# Altium project Adapter_Board-v1.0.PrjPcb
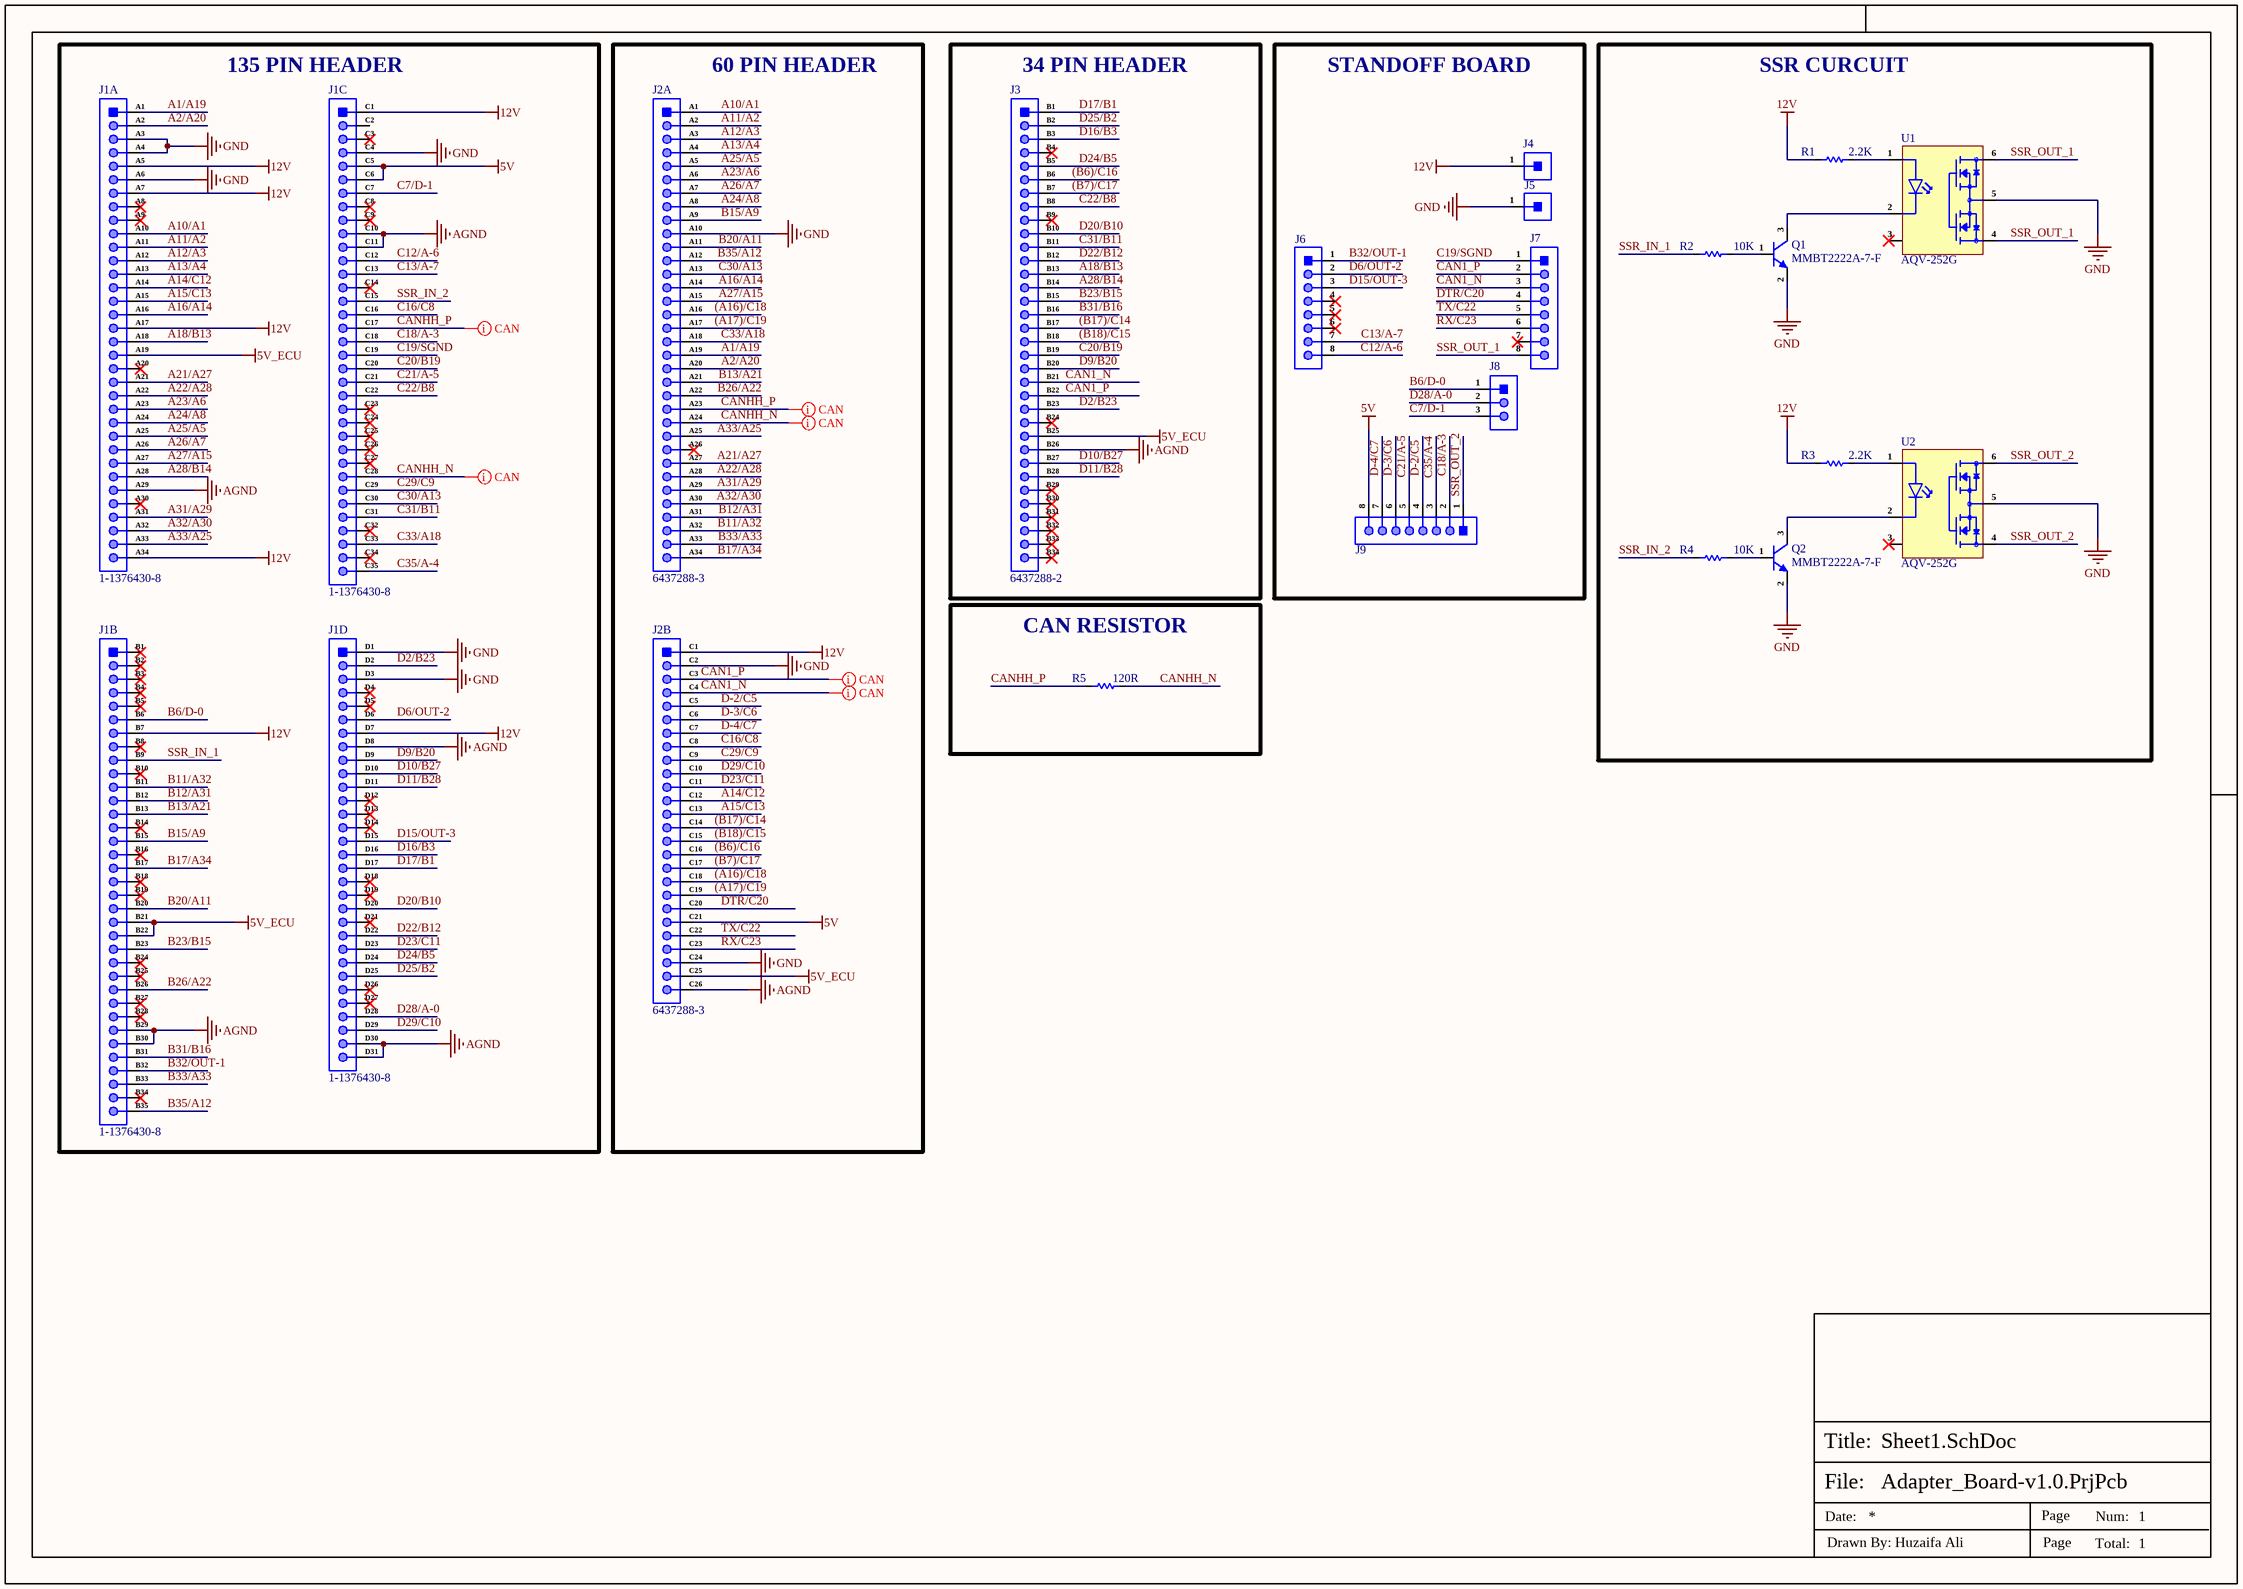
[diagram p0: Sheet1.SchDoc]
1 sheet, 18 parts. Net scope: global (net labels, ports and power ports of the same name join across sheets).
Board file: PCB_Adaptor_Board-v1.0.PcbDoc

## Sheet Sheet1.SchDoc
size 420 x 297 mm; SheetNumber: 1; SheetTotal: 1

### Parts
J1  1-1376430-8  [1-1376430-8]  (parts A,B,C,D of 4)
J2  6437288-3  [6437288-3]  (parts A,B of 2)
J3  6437288-2  [6437288-2]
J4  X6511WV-01H-C60D30  [HDR 1x1 TH Male]  (value not drawn)
J5  X6511WV-01H-C60D30  [HDR 1x1 TH Male]  (value not drawn)
J6  X6511WV-08H-C60D30  [HDR 1x8 TH male]  (value not drawn)
J7  X6511WV-08H-C60D30  [HDR 1x8 TH male]  (value not drawn)
J8  X6511WV-03H-C60D30  [HDR1X3_]  (value not drawn)
J9  X6511WV-08H-C60D30  [HDR 1x8 TH male]  (value not drawn)
Q1  MMBT2222A-7-F  [SOT-23]
Q2  MMBT2222A-7-F  [SOT-23]
R1  2.2K  [Res-0603]
R2  10K  [Res-0603]
R3  2.2K  [Res-0603]
R4  10K  [Res-0603]
R5  120R  [Res-0603]
U1  AQV-252G  [6-DIP]
U2  AQV-252G  [6-DIP]

### Blocks framed on the sheet
135 PIN HEADER: J1
60 PIN HEADER: J2
34 PIN HEADER: J3
STANDOFF BOARD: J4-J9
SSR CURCUIT: Q1 Q2 R1-R4 U1 U2
CAN RESISTOR: R5

### Nets
5V: J1.C5 J1.C6 J2.C21 J9.8
5V_ECU: J1.A19 J1.B21 J1.B22 J2.C25 J3.B25
12V: J1.A5 J1.A7 J1.A17 J1.A34 J1.B7 J1.C1 J1.D7 J2.C1 J4.1 R1.2 R3.2
AGND: J1.A29 J1.B29 J1.B30 J1.C10 J1.C11 J1.D8 J1.D30 J1.D31 J2.C26 J3.B26
GND: J1.A3 J1.A4 J1.A6 J1.C4 J1.D1 J1.D3 J2.A10 J2.C2 J2.C24 J5.1 Q1.2(E) Q2.2(E) U1.5 U2.5
(A16)/C18: J2.A16 J2.C18
(A17)/C19: J2.A17 J2.C19
(B6)/C16: J2.C16 J3.B6
(B7)/C17: J2.C17 J3.B7
(B17)/C14: J2.C14 J3.B17
(B18)/C15: J2.C15 J3.B18
A1/A19: J1.A1 J2.A19
A2/A20: J1.A2 J2.A20
A10/A1: J1.A10 J2.A1
A11/A2: J1.A11 J2.A2
A12/A3: J1.A12 J2.A3
A13/A4: J1.A13 J2.A4
A14/C12: J1.A14 J2.C12
A15/C13: J1.A15 J2.C13
A16/A14: J1.A16 J2.A14
A18/B13: J1.A18 J3.B13
A21/A27: J1.A21 J2.A27
A22/A28: J1.A22 J2.A28
A23/A6: J1.A23 J2.A6
A24/A8: J1.A24 J2.A8
A25/A5: J1.A25 J2.A5
A26/A7: J1.A26 J2.A7
A27/A15: J1.A27 J2.A15
A28/B14: J1.A28 J3.B14
A31/A29: J1.A31 J2.A29
A32/A30: J1.A32 J2.A30
A33/A25: J1.A33 J2.A25
B6/D-0: J1.B6 J8.1
B11/A32: J1.B11 J2.A32
B12/A31: J1.B12 J2.A31
B13/A21: J1.B13 J2.A21
B15/A9: J1.B15 J2.A9
B17/A34: J1.B17 J2.A34
B20/A11: J1.B20 J2.A11
B23/B15: J1.B23 J3.B15
B26/A22: J1.B26 J2.A22
B31/B16: J1.B31 J3.B16
B32/OUT-1: J1.B32 J6.1
B33/A33: J1.B33 J2.A33
B35/A12: J1.B35 J2.A12
C7/D-1: J1.C7 J8.3
C12/A-6: J1.C12 J6.8
C13/A-7: J1.C13 J6.7
C16/C8: J1.C16 J2.C8
C18/A-3: J1.C18 J9.2
C19/SGND: J1.C19 J7.1
C20/B19: J1.C20 J3.B19
C21/A-5: J1.C21 J9.5
C22/B8: J1.C22 J3.B8
C29/C9: J1.C29 J2.C9
C30/A13: J1.C30 J2.A13
C31/B11: J1.C31 J3.B11
C33/A18: J1.C33 J2.A18
C35/A-4: J1.C35 J9.3
CAN1_N: J2.C4 J3.B21 J7.3
CAN1_P: J2.C3 J3.B22 J7.2
CANHH_N: J1.C28 J2.A24 R5.2
CANHH_P: J1.C17 J2.A23 R5.1
D2/B23: J1.D2 J3.B23
D6/OUT-2: J1.D6 J6.2
D9/B20: J1.D9 J3.B20
D10/B27: J1.D10 J3.B27
D11/B28: J1.D11 J3.B28
D15/OUT-3: J1.D15 J6.3
D16/B3: J1.D16 J3.B3
D17/B1: J1.D17 J3.B1
D20/B10: J1.D20 J3.B10
D22/B12: J1.D22 J3.B12
D23/C11: J1.D23 J2.C11
D24/B5: J1.D24 J3.B5
D25/B2: J1.D25 J3.B2
D28/A-0: J1.D28 J8.2
D29/C10: J1.D29 J2.C10
D-2/C5: J2.C5 J9.4
D-3/C6: J2.C6 J9.6
D-4/C7: J2.C7 J9.7
DTR/C20: J2.C20 J7.4
RX/C23: J2.C23 J7.6
SSR_IN_1: J1.B9 R2.1
SSR_IN_2: J1.C15 R4.1
SSR_OUT_1: J7.8 U1.4 U1.6
SSR_OUT_2: J9.1 U2.4 U2.6
TX/C22: J2.C22 J7.5
NetQ1_1: Q1.1(B) R2.2
NetQ1_3: Q1.3(C) U1.2
NetQ2_1: Q2.1(B) R4.2
NetQ2_3: Q2.3(C) U2.2
NetR1_1: R1.1 U1.1
NetR3_1: R3.1 U2.1

Not connected (* = marked no-connect by the designer): J1 A8* A9* A20* A30* B1* B2* B3* B4* B5* B8* B10* B14* B16* B18* B19* B24* B25* B27* B28* B34* C2 C3* C8* C9* C14* C23* C24* C25* C26* C27* C32* C34* D4* D5* D12* D13* D14* D18* D19* D21* D26* D27*; J2 A26*; J3 B4* B9* B24* B29* B30* B31* B32* B33* B34*; J6 4* 5* 6*; J7 7*; U1 3*; U2 3*

### Layout directives
differential pair; rule Matched Net Lengths [Tolerance = 20mil]; rule Impedance Constraint [Min = 118.0    Max = 120.0    ]: CAN1_N, CAN1_P, CANHH_N, CANHH_P

### Notes on the sheet
- File:
- Title:
- Date:
- Page
- Num:
- Total:
- Drawn By: Huzaifa Ali

### Library data of the parts
J1 = 1-1376430-8: 025/040 135POS CAP ASSY H TIN; Manufacturer: TE Connectivity Raychem; Item Type: Connector; Supplier 1: Digikey; Manufacturer Part Number: 1-1376430-8; RoHS: Yes; Category: Connectors; Stock 1: 1632; Pricing 1: 1=11.55, 12=10.02667 (USD); Supplier Part Number 1: 17-1-1376430-8-ND
J2 = 6437288-3: CONN HEADER R/A 60POS 3MM; Manufacturer: TE Connectivity; Item Type: Connector; Supplier 1: Digikey; Manufacturer Part Number: 6437288-3; RoHS: Yes; Category: Headers and Wire Housings; Stock 1: 2119; Pricing 1: 1=23.56, 16=19.44938, 104=16.70635, 504=15.95829 (USD); ComponentLink1URL: https://datasheet.ciiva.com/11742/0900766b80fa0058-11742813.pdf?src-supplier=Rs; ComponentLink1Description: https://datasheet.ciiva.com/11742/0900766b80fa0058-11742813.pdf?src-supplier=Rs; ComponentLink2URL: https://datasheet.ciiva.com/31837/18928ddetrolleractionshowdocdocidcatalogsection7f1308072-2-gad-lit-31837713.pdf?src-supplier=Onlinecomponents.com; ComponentLink2Description: https://datasheet.ciiva.com/31837/18928ddetrolleractionshowdocdocidcatalogsection7f1308072-2-gad-lit-31837713.pdf?src-supplier=Onlinecomponents.com; ComponentLink3URL: https://datasheet.ciiva.com/9491/eng-cs-1308072-2-gad-lit-amp-superseal-0608-9491339.pdf?src-supplier=Avnet; ComponentLink3Description: https://datasheet.ciiva.com/9491/eng-cs-1308072-2-gad-lit-amp-superseal-0608-9491339.pdf?src-supplier=Avnet; Supplier Part Number 1: A122211-ND
J3 = 6437288-2: CONN HEADER R/A 34POS 3MM; Manufacturer: TE Connectivity; Item Type: Connectors; Supplier: Avnet; Supplier Part Number: 69AH5934; Manufacturer Part Number: 6437288-2; RoHS: Yes; Stock: 15; Pricing: 1=21.65, 5=21.15, 10=20.79, 25=20.4, 50=19.97 (USD); ComponentLink1URL: https://datasheet.ciiva.com/11755/0900766b80f79e47-11755892.pdf?src-supplier=Rs; ComponentLink1Description: https://datasheet.ciiva.com/11755/0900766b80f79e47-11755892.pdf?src-supplier=Rs; ComponentLink2URL: https://datasheet.ciiva.com/9496/eng-cs-1308072-2-gad-lit-amp-superseal-0608-9496917.pdf?src-supplier=Avnet; ComponentLink2Description: https://datasheet.ciiva.com/9496/eng-cs-1308072-2-gad-lit-amp-superseal-0608-9496917.pdf?src-supplier=Avnet
J4 J5 = X6511WV-01H-C60D30: Gold 250V 3A Square Pins 2.5mm 1P 260℃ 6mm -40℃~+105℃ 3mm 2.54mm Brass Black Plugin 2.54mm 1x1P Plugin,P=2.54mm Pin Headers ROHS; Manufacturer: XKB; Item Type: Male Header; Manufacturer Part Number: X6511WV-01H-C60D30; Package: Plugin,P=2.54mm; LCSC Part Number: C5242194; ComponentLink1Description: LCSC; ComponentLink1URL: https://www.lcsc.com/product-detail/Pin-Headers_XKB-Connection-X6511WV-01H-C60D30_C5242194.html
J6 J7 J9 = X6511WV-08H-C60D30: Gold 250V 3A Square Pins 2.5mm 8P 260℃ 6mm -40℃~+105℃ 3mm 2.54mm Plugin Black Brass 2.54mm 1x8P Plugin,P=2.54mm Pin Headers ROHS; Manufacturer: XKB; Item Type: Male Header; Manufacturer Part Number: X6511WV-08H-C60D30; Package: Plugin,P=2.54mm; LCSC Part Number: C706880; ComponentLink1Description: LCSC; ComponentLink1URL: https://www.lcsc.com/product-detail/Pin-Headers_XKB-Connection-X6511WV-08H-C60D30_C706880.html
J8 = X6511WV-03H-C60D30: Gold 250V 3A Straight Square Pins 2.5mm 3P 260℃ 6mm -40℃~+105℃ 3mm 2.54mm Plugin Black Brass 1x3P Plugin,P=2.54mm Pin Headers ROHS; Manufacturer: XKB; Item Type: Male Header; Manufacturer Part Number: X6511WV-03H-C60D30; Package: Plugin,P=2.54mm; LCSC Part Number: C706875; ComponentLink1Description: LCSC; ComponentLink1URL: https://www.lcsc.com/product-detail/Pin-Headers_XKB-Connectivity-X6511WV-03H-C60D30_C706875.html
Q1 Q2 = MMBT2222A-7-F: TRANS NPN 40V 0.6A SMD SOT23-3; Manufacturer: Diodes; Max Power Dissipation: 300mW; Collector Base Voltage (VCBO): 75V; Max Collector Current: 600mA; hFE Min: 100; Frequency: 300MHz; Number of Elements: 1; Emitter Base Voltage (VEBO): 6V; Collector Emitter Saturation Voltage: 1V; Power Dissipation: 350mW; Element Configuration: Single; Current: 1A; Item Type: Mosfet; Supplier 1: Digi-Key; Manufacturer Part Number: MMBT2222A-7-F; Stock 1: 2471182; Pricing 1: 1=0.15, 10=0.134, 100=0.0729, 500=0.04486, 1000=0.03059 (USD); Mount: Surface Mount; Case/Package: SOT-23; Number of Pins: 3; Weight: 0.000282oz; Contact Plating: Matte,Tin; Min Operating Temperature: -55°C; Max Operating Temperature: 150°C; Packaging: Tape and Reel; Collector Emitter Voltage (VCEO): 40V; Polarity: NPN; Voltage Rating (DC): 40V; Package Quantity: 3000; Continuous Collector Current: 600mA; Collector Emitter Breakdown Voltage: 40V; Transition Frequency: 300MHz; Max Breakdown Voltage: 40V; Max Frequency: 300MHz; Termination: SMD/SMT; Gain Bandwidth Product: 300MHz; Current Rating: 600mA; Voltage: 40V; Length: 3.05mm; Height: 1mm; Width: 1.4mm; Radiation Hardening: No; Lead Free: Lead Free; REACH SVHC: No SVHC; ComponentLink1URL: http://www.diodes.com/datasheets/ds30041.pdf?src-supplier=Future+Electronics; ComponentLink1Description: http://www.diodes.com/datasheets/ds30041.pdf?src-supplier=Future+Electronics; ComponentLink2URL: http://www.diodes.com/datasheets/ds30041.pdf?src-supplier=Avnet; ComponentLink2Description: http://www.diodes.com/datasheets/ds30041.pdf?src-supplier=Avnet; ComponentLink3URL: https://www.verical.com/server-webapp/html/getDatasheet?partID=82692&src-supplier=Verical; ComponentLink3Description: https://www.verical.com/server-webapp/html/getDatasheet?partID=82692&src-supplier=Verical; ComponentLink4URL: https://www.diodes.com/assets/Datasheets/ds30041.pdf?src-supplier=Digi-Key; ComponentLink4Description: https://www.diodes.com/assets/Datasheets/ds30041.pdf?src-supplier=Digi-Key; ComponentLink5URL: http://www.diodes.com/datasheets/ds30041.pdf?src-supplier=Avnet+Europe; ComponentLink5Description: http://www.diodes.com/datasheets/ds30041.pdf?src-supplier=Avnet+Europe; ComponentLink6URL: http://www.diodes.com/datasheets/ds30041.pdf?src-supplier=Element14; ComponentLink6Description: http://www.diodes.com/datasheets/ds30041.pdf?src-supplier=Element14; Supplier Part Number 1: MMBT2222A-FDIDKR-ND; LCSC Part Number: C94515
R1 R3 = RT0603BRB072K2L: RES SMD 2.2K OHM 0.1% 1/10W 0603; Manufacturer: Yageo; Value: 2.2kR; Max Power Dissipation: 100mW; Temperature Coefficient: 10ppm/°C; Item Type: Resistor; Supplier: Digi-Key; Supplier Part Number: YAG2182CT-ND; Manufacturer Part Number: RT0603BRB072K2L; RoHS: Yes; Category: Chip SMD Resistors; Stock: 518; Pricing: 1=0.6, 10=0.446, 50=0.3148, 100=0.2597, 500=0.1836, 1000=0.14563 (USD); Case/Package: 0603; Case Code (Metric): 1608; Case Code (Imperial): 0603; Min Operating Temperature: -55°C; Max Operating Temperature: 155°C; Packaging: Cut Tape; Number of Terminations: 2; Tolerance: 0.1%; Series: RT; RoHS Compliant: Yes; ComponentLink1URL: http://www.yageo.com/documents/recent/PYu-RT_1-to-0.01_RoHS_L_7.pdf?src-supplier=Digi-Key; ComponentLink1Description: http://www.yageo.com/documents/recent/PYu-RT_1-to-0.01_RoHS_L_7.pdf?src-supplier=Digi-Key; ComponentLink2URL: http://www.yageo.com/documents/recent/PYu-RT_1-to-0.01_RoHS_L_9.pdf?src-supplier=Digi-Key; ComponentLink2Description: http://www.yageo.com/documents/recent/PYu-RT_1-to-0.01_RoHS_L_9.pdf?src-supplier=Digi-Key; LCSC Part Number: C860297
R2 R4 = RC0603FR-0710KL: RES SMD 10K Ohm 1% 1/10W 0603; Manufacturer: Yageo; Resistance: 10kR; Temperature Coefficient: 100ppm/°C; Voltage Rating (DC): 50V; Power Rating: 100mW; Voltage Rating: 75V; Item Type: Resistor; Supplier 1: Digi-Key; Manufacturer Part Number: RC0603FR-0710KL; RoHS: Yes; Category: Chip SMD Resistors; Stock 1: 25249139; Pricing 1: 1=0.10000, 10=0.02400, 100=0.00970, 1000=0.00436, 2500=0.00378 (USD); Case/Package: 0603; Number of Pins: 2; Case Code (Imperial): 0603; Case Code (Metric): 1608; Weight: 7.1E-05oz; Size Code: 0603; Min Operating Temperature: -55°C; Max Operating Temperature: 155°C; Tolerance: 1%; Resistor Type: Thick Film; Packaging: Tape and Reel; Termination: SMD/SMT; Features: Moisture Resistant; Series: RC; Max Power Dissipation: 100mW; Number of Terminations: 2; Resistance Tolerance: 1%; Construction: Rectangular; Length: 1.6mm; Width: 0.8mm; Height: 0.45mm; Depth: 0.8mm; Lead Pitch: 0.3mm; REACH SVHC: Unknown; Lead Free: Lead Free; Military Standard: Not; RoHS Compliant: Yes; ComponentLink1URL: https://datasheet.ciiva.com/7660/38590-7660789.pdf?src-supplier=Element14; ComponentLink1Description: https://datasheet.ciiva.com/7660/38590-7660789.pdf?src-supplier=Element14; ComponentLink2URL: https://datasheet.ciiva.com/7983/443971-7983596.pdf?src-supplier=Element14; ComponentLink2Description: https://datasheet.ciiva.com/7983/443971-7983596.pdf?src-supplier=Element14; ComponentLink3URL: https://datasheet.ciiva.com/22747/443971-22747519.pdf?src-supplier=Element14; ComponentLink3Description: https://datasheet.ciiva.com/22747/443971-22747519.pdf?src-supplier=Element14; ComponentLink4URL: https://datasheet.ciiva.com/46440/1868787-46440891.pdf?src-supplier=Element14; ComponentLink4Description: https://datasheet.ciiva.com/46440/1868787-46440891.pdf?src-supplier=Element14; ComponentLink5URL: https://datasheet.ciiva.com/7746/1738695-7746239.pdf?src-supplier=Element14; ComponentLink5Description: https://datasheet.ciiva.com/7746/1738695-7746239.pdf?src-supplier=Element14; ComponentLink6URL: https://datasheet.ciiva.com/15189/getdatasheetpartid-409289-15189591.pdf?src-supplier=Verical; ComponentLink6Description: https://datasheet.ciiva.com/15189/getdatasheetpartid-409289-15189591.pdf?src-supplier=Verical; Supplier Part Number 1: 311-10.0KHRCT-ND; LCSC Part Number: C98220
R5 = RC0603FR-07120RL: RES 120 OHM 1% 1/10W 0603; Manufacturer: Yageo; Temperature Coefficient: 100ppm/°C; Voltage Rating (DC): 50V; Power Rating: 100mW; Item Type: Resistor; Supplier 1: Digi-Key; Manufacturer Part Number: RC0603FR-07120RL; RoHS: Yes; Category: Chip SMD Resistors; Stock 1: 839061; Pricing 1: 1=0.10000, 10=0.02400, 100=0.00970, 1000=0.00436, 2500=0.00378 (USD); Case/Package: 0603; Number of Pins: 2; Case Code (Metric): 1608; Case Code (Imperial): 0603; Size Code: 0603; Min Operating Temperature: -55°C; Max Operating Temperature: 155°C; Resistance: 120R; Tolerance: 1%; Resistor Type: Thick Film; Packaging: Tape and Reel; Voltage Rating: 50V; Package Quantity: 1; Number of Terminations: 2; Termination: SMD/SMT; Max Power Dissipation: 100mW; Features: Moisture Resistant; Series: RC; Construction: Rectangular; Resistance Tolerance: 1%; Length: 1.6mm; Width: 0.031inch; Height: 0.022inch; Depth: 0.8mm; REACH SVHC: No SVHC; Lead Free: Lead Free; Military Standard: Not; RoHS Compliant: Yes; ComponentLink1URL: https://datasheet.ciiva.com/2553/pyu-r-int-thick-7-2553512.pdf?src-supplier=Digi-Key; ComponentLink1Description: https://datasheet.ciiva.com/2553/pyu-r-int-thick-7-2553512.pdf?src-supplier=Digi-Key; ComponentLink2URL: https://datasheet.ciiva.com/7746/443971-7746248.pdf?src-supplier=Element14; ComponentLink2Description: https://datasheet.ciiva.com/7746/443971-7746248.pdf?src-supplier=Element14; ComponentLink3URL: https://datasheet.ciiva.com/2553/pyu-r-int-thick-7-2553513.pdf?src-supplier=Digi-Key; ComponentLink3Description: https://datasheet.ciiva.com/2553/pyu-r-int-thick-7-2553513.pdf?src-supplier=Digi-Key; ComponentLink4URL: https://datasheet.ciiva.com/7746/443971-7746249.pdf?src-supplier=Element14; ComponentLink4Description: https://datasheet.ciiva.com/7746/443971-7746249.pdf?src-supplier=Element14; ComponentLink5URL: https://datasheet.ciiva.com/2553/pyu-r-int-thick-7-2553514.pdf?src-supplier=Digi-Key; ComponentLink5Description: https://datasheet.ciiva.com/2553/pyu-r-int-thick-7-2553514.pdf?src-supplier=Digi-Key; ComponentLink6URL: https://datasheet.ciiva.com/46395/443971-46395021.pdf?src-supplier=Element14; ComponentLink6Description: https://datasheet.ciiva.com/46395/443971-46395021.pdf?src-supplier=Element14; Supplier Part Number 1: 311-120HRCT-ND; LCSC Part Number: C114640
U1 U2 = AQV-252G: SSR RELAY SPST-NO 2.5A 0-60V; Manufacturer: Panasonic; Item Type: Solid State Relays; Max Supply Voltage: 1.5V; Max Output Voltage: 60V; Max Input Current: 50mA; Isolation Voltage: 1.5kV; Throw Configuration: SPST; Forward Current: 500uA; Input Type: DC; On-State Resistance: 80mR; Rise Time: 1.1ms; On-state Resistance-Max: 120mR; Turn-On Delay Time: 5ms; Test Voltage: 2.5kV; Power Dissipation: 550mW; Value: 0.8pF; Approvals: UL,VDE; Supplier: Mouser; Supplier Part Number: 769-AQV252G; Manufacturer Part Number: AQV-252G; RoHS: Yes; Stock: 4354; Pricing: 1=4.87, 10=3.86, 50=3.86, 100=3.66, 1000=3.04, 10000=3.04 (USD); Case/Package: DIP; Pins: 6; Min Operating Temperature: -40°C; Max Operating Temperature: 85°C; Max Output current: 2.5A; Packaging: Rail/Tube; Package Quantity: 50; Output Current: 2.5A; Termination: PC Pin; Load Current: 2.5A; Input Current: 50mA; Series: PhotoMOS™ AQV; Output Voltage: 60V; Isolation Voltage-Max: 1.5kV; Current Rating: 2.5A; Voltage Rating (AC): 60V; Contact Resistance: 80mR; Contact Type: 1 maker; Length: 8.8mm; Width: 6.4mm; Height: 3.9mm; Depth: 6.4mm; Radiation Hardening: No; Reach SVHC Compliant: No; RoHS Compliant: Yes; Lead Free: Lead Free; ComponentLink1URL: https://datasheet.ciiva.com/14667/0900766b80e30c04-14667104.pdf?src-supplier=Rs; ComponentLink1Description: https://datasheet.ciiva.com/14667/0900766b80e30c04-14667104.pdf?src-supplier=Rs; ComponentLink2URL: https://datasheet.ciiva.com/19470/991220-19470769.pdf?src-supplier=Jameco; ComponentLink2Description: https://datasheet.ciiva.com/19470/991220-19470769.pdf?src-supplier=Jameco; ComponentLink3URL: https://datasheet.ciiva.com/26327/504861-da-01-en-photomos-relais-1a-2500ma-60v-aqv252g-26327386.pdf?src-supplier=Conrad; ComponentLink3Description: https://datasheet.ciiva.com/26327/504861-da-01-en-photomos-relais-1a-2500ma-60v-aqv252g-26327386.pdf?src-supplier=Conrad; ComponentLink4URL: https://datasheet.ciiva.com/1190/1794196-1190567.pdf?src-supplier=Newark; ComponentLink4Description: https://datasheet.ciiva.com/1190/1794196-1190567.pdf?src-supplier=Newark; ComponentLink5URL: https://datasheet.ciiva.com/48435/cfaqv252g-data-e-48435733.pdf?src-supplier=Distrelec; ComponentLink5Description: https://datasheet.ciiva.com/48435/cfaqv252g-data-e-48435733.pdf?src-supplier=Distrelec; ComponentLink6URL: https://datasheet.ciiva.com/1526/1848833-1526253.pdf?src-supplier=Element14; ComponentLink6Description: https://datasheet.ciiva.com/1526/1848833-1526253.pdf?src-supplier=Element14; ComponentLink7URL: https://datasheet.ciiva.com/2421/photomosdimensions2-2421589.pdf?src-supplier=Digikey; ComponentLink7Description: https://datasheet.ciiva.com/2421/photomosdimensions2-2421589.pdf?src-supplier=Digikey; ComponentLink8URL: https://datasheet.ciiva.com/18421/70158328-18421196.pdf?src-supplier=Allied+Electronics; ComponentLink8Description: https://datasheet.ciiva.com/18421/70158328-18421196.pdf?src-supplier=Allied+Electronics